# Altium schematic sheet Input.SchDoc
size 76 x 45 mm
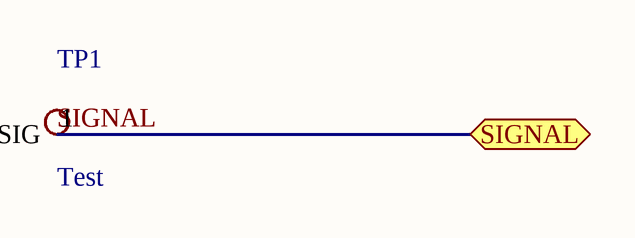
[diagram p0: Input.SchDoc]

## Parts
TP1  Test

## Ports
SIGNAL

## Nets
SIGNAL: TP1.1(SIG) ; port SIGNAL

## Library data of the parts
TP1 = Tap